# Altium schematic sheet vi_dieu_khien.SchDoc
size C; SheetNumber: 2; SheetTotal: 5
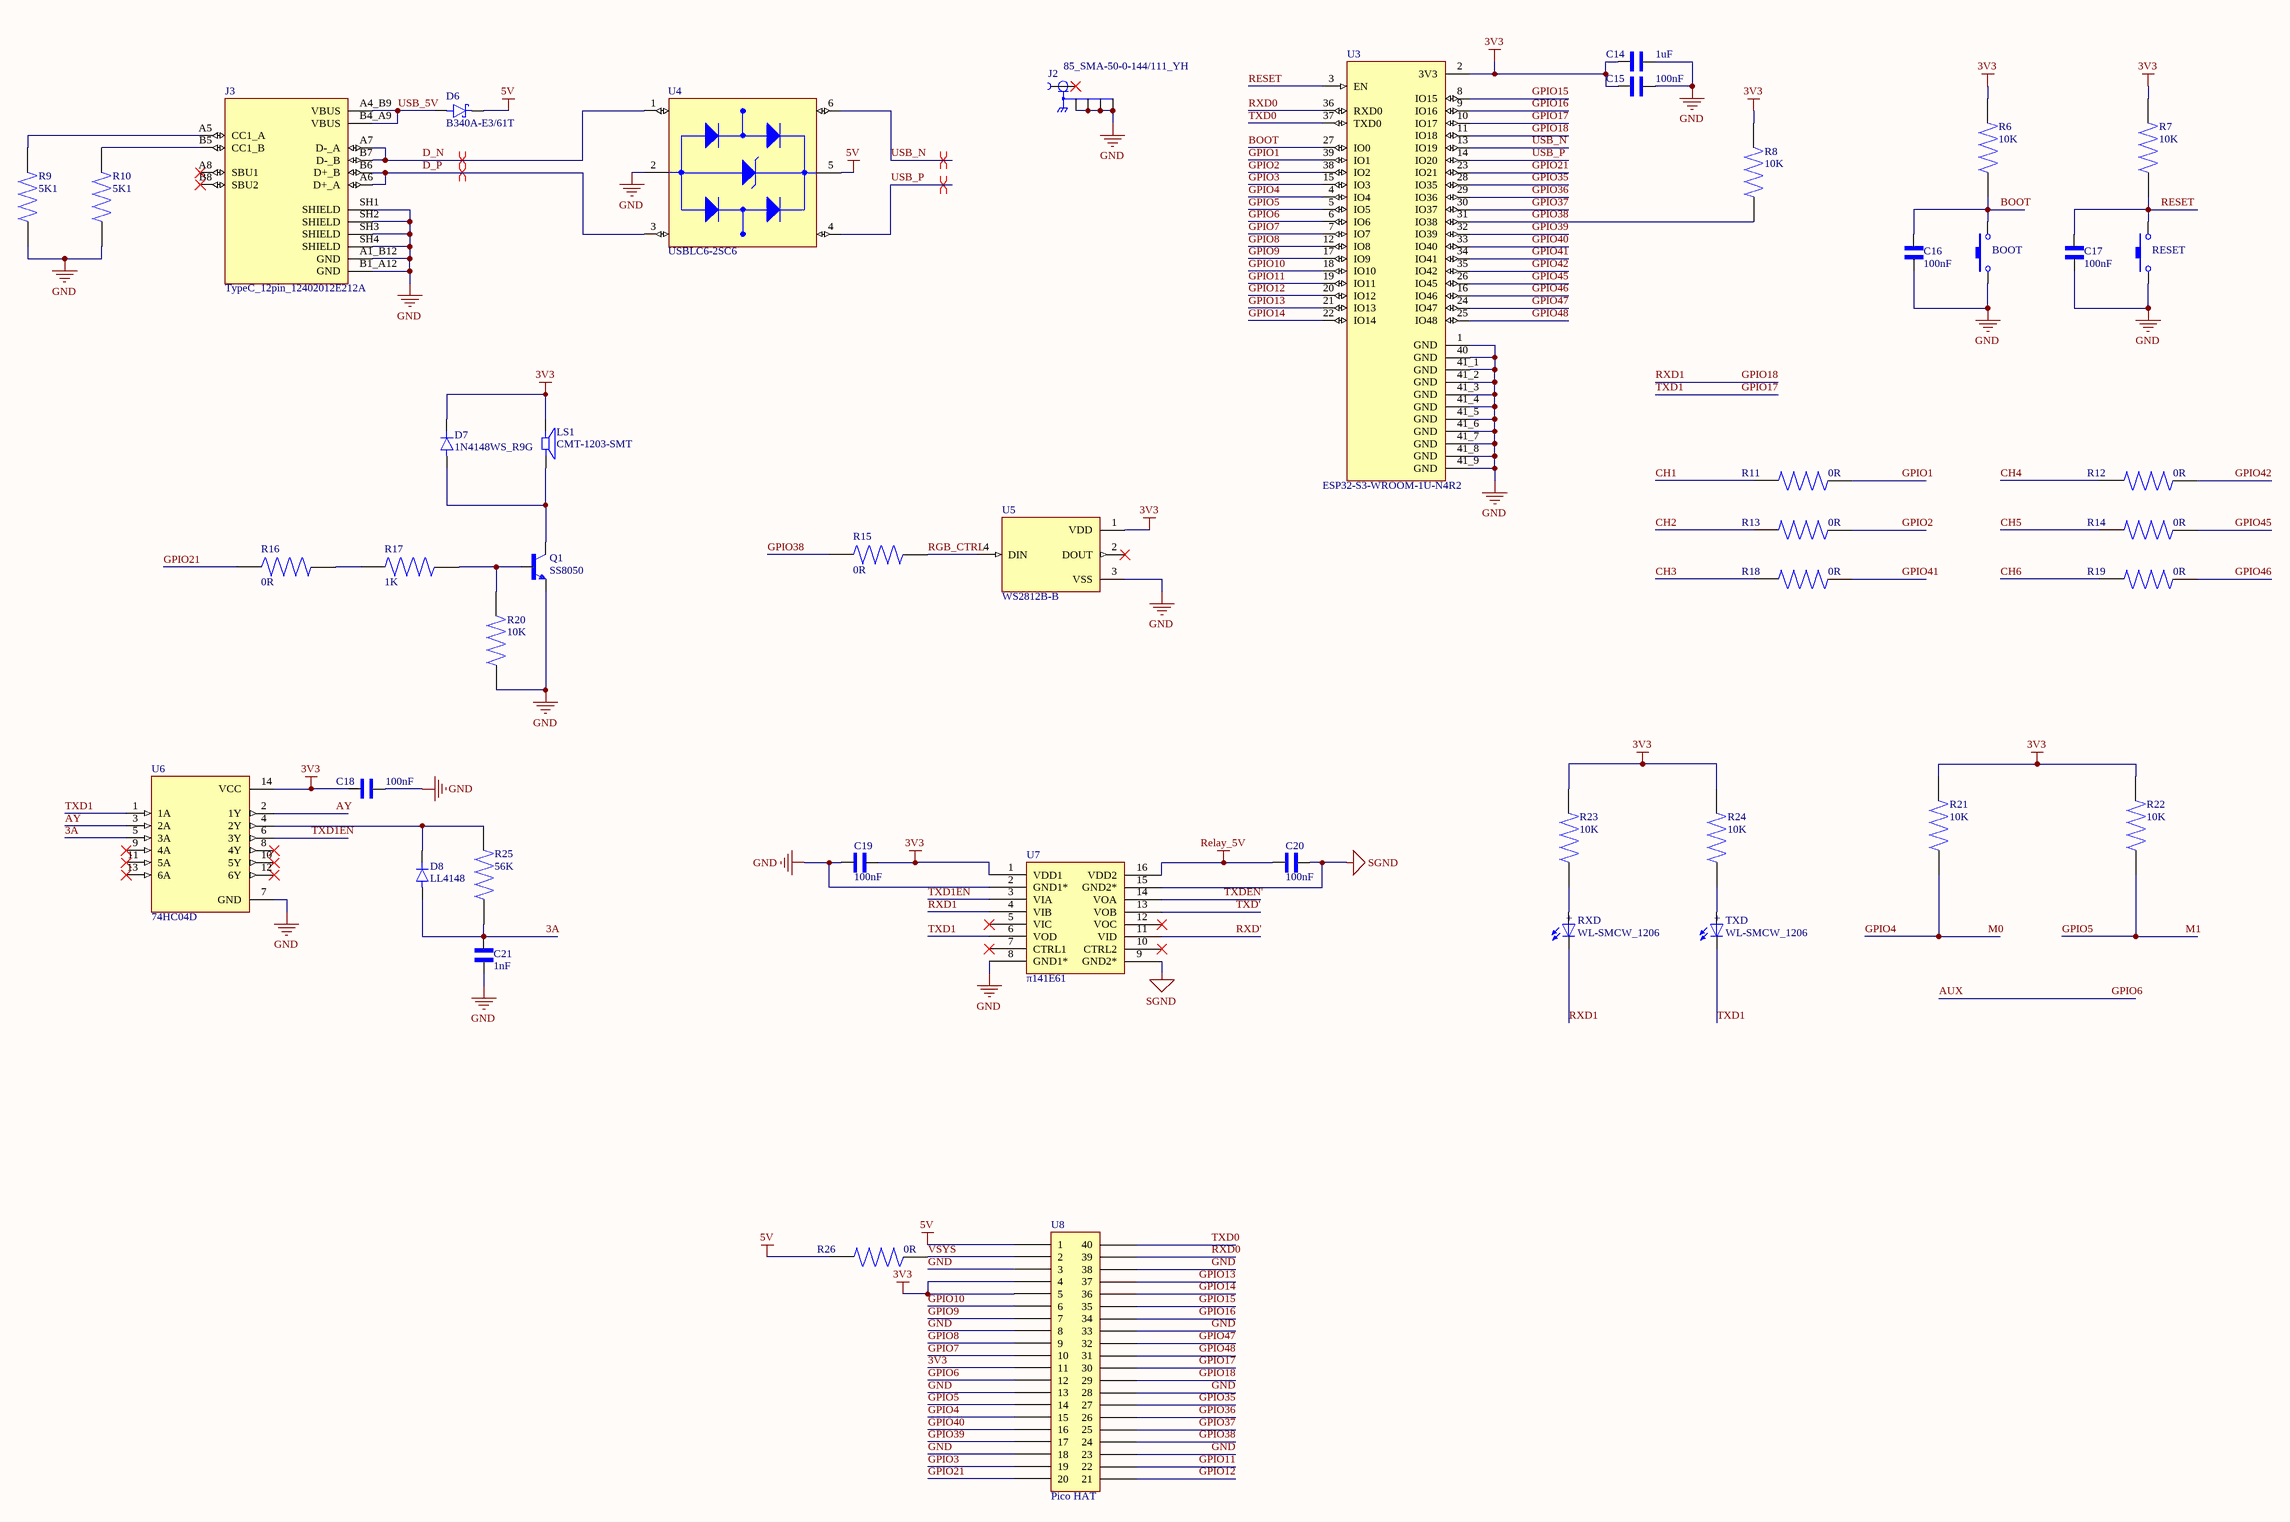
[diagram p0: vi_dieu_khien.SchDoc]

## Parts
BOOT  Nut Nhan 2 Chan SMD 3x6x2.5  [PCBComponent_1]  (value not drawn)
C14  1uF  [CAPC1608X94N]
C15  100nF  [CAPC1608X94N]
C16  100nF  [CAPC1608X94N]
C17  100nF  [CAPC1608X94N]
C18  100nF  [CAPC1608X94N]
C19  100nF  [CAPC1608X94N]
C20  100nF  [CAPC1608X94N]
C21  1nF  [CAPC1608X94N]
D6  B340A-E3/61T  [DIOM5126X229N]
D7  1N4148WS_R9G  [DIO_1N4148WS_R9G]
D8  LL4148  [DIO_LL4148]
J2  85_SMA-50-0-144/111_YH  [HUBER+SUHNER_85_SMA-50-0-144/111_YH]
J3  TypeC_12pin_12402012E212A  [TypeC_12pin_12402012E212A]
LS1  CMT-1203-SMT  [CUI_CMT-1203-SMT]
Q1  SS8050  [SOT-23_BEC]
R6  10K  [RES_ERJU03J474V]
R7  10K  [RES_ERJU03J474V]
R8  10K  [RES_ERJU03J474V]
R9  5K1  [RES_ERJU03J474V]
R10  5K1  [RES_ERJU03J474V]
R11  0R  [RES_ERJU03J474V]
R12  0R  [RES_ERJU03J474V]
R13  0R  [RES_ERJU03J474V]
R14  0R  [RES_ERJU03J474V]
R15  0R  [RES_ERJU03J474V]
R16  0R  [RES_ERJU03J474V]
R17  1K  [RES_ERJU03J474V]
R18  0R  [RES_ERJU03J474V]
R19  0R  [RES_ERJU03J474V]
R20  10K  [RES_ERJU03J474V]
R21  10K  [RES_ERJU03J474V]
R22  10K  [RES_ERJU03J474V]
R23  10K  [RES_ERJU03J474V]
R24  10K  [RES_ERJU03J474V]
R25  56K  [RES_ERJU03J474V]
R26  0R  [RES_ERJU03J474V]
RESET  Nut Nhan 2 Chan SMD 3x6x2.5  [PCBComponent_1]  (value not drawn)
RXD  WL-SMCW_1206  [WL-SMCW_1206]
TXD  WL-SMCW_1206  [WL-SMCW_1206]
U3  ESP32-S3-WROOM-1U-N4R2  [XCVR_ESP32-S3-WROOM-1U-N4R2]
U4  USBLC6-2SC6  [USBLC6-2SC6]
U5  WS2812B-B  [LED_WS2812B-B]
U6  74HC04D  [SOP127P600X170-14N]
U7  π141E61  [SOIC127P1032X265-16N]
U8  Pico HAT  [Pico_HAT]

## Nets
3V3: C14.1 C15.1 C18.1 C19.1 D7.C(K) LS1.1 R6.2 R7.2 R8.2 R21.2 R22.2 R23.2 R24.2 U3.2(3V3) U5.1(VDD) U6.14(VCC) U7.1(VDD1) U8.4 U8.5 U8.11
5V: D6.C R26.2 U4.5(VBUS) U8.1
GND: BOOT.1 C14.2 C15.2 C16.1 C17.1 C18.2 C19.2 C21.1 J2.G1 J2.G2 J2.G3 J2.G4 J3.A1_B12(GND) J3.B1_A12(GND) J3.SH1(SHIELD) J3.SH2(SHIELD) J3.SH3(SHIELD) J3.SH4(SHIELD) Q1.E R9.1 R10.1 R20.1 RESET.1 U3.1(GND) U3.40(GND) U3.41_1(GND) U3.41_2(GND) U3.41_3(GND) U3.41_4(GND) U3.41_5(GND) U3.41_6(GND) U3.41_7(GND) U3.41_8(GND) U3.41_9(GND) U4.2(GND) U5.3(VSS) U6.7(GND) U7.2(GND1*) U7.8(GND1*) U8.3 U8.8 U8.13 U8.18 U8.23 U8.28 U8.33 U8.38
Relay_5V: C20.2 U7.16(VDD2)
SGND: C20.1 U7.9(GND2*) U7.15(GND2*)
3A: C21.2 D8.A R25.1 U6.5(3A)
AUX: U3.6(IO6) U8.12  [also labelled GPIO6]
AY: U6.2(1Y) U6.3(2A)
BOOT: BOOT.2 C16.2 R6.1 U3.27(IO0)
CH1: R11.2
CH2: R13.2
CH3: R18.2
CH4: R12.2
CH5: R14.2
CH6: R19.2
D_N: J3.A7(D-_A) J3.B7(D-_B) U4.1(I/O1_IN)
D_P: J3.A6(D+_A) J3.B6(D+_B) U4.3(I/O2_IN)
GPIO1: R11.1 U3.39(IO1)
GPIO2: R13.1 U3.38(IO2)
GPIO3: U3.15(IO3) U8.19
GPIO4: R21.1 U3.4(IO4) U8.15  [also labelled M0]
GPIO5: R22.1 U3.5(IO5) U8.14  [also labelled M1]
GPIO7: U3.7(IO7) U8.10
GPIO8: U3.12(IO8) U8.9
GPIO9: U3.17(IO9) U8.7
GPIO10: U3.18(IO10) U8.6
GPIO11: U3.19(IO11) U8.22
GPIO12: U3.20(IO12) U8.21
GPIO13: U3.21(IO13) U8.37
GPIO14: U3.22(IO14) U8.36
GPIO15: U3.8(IO15) U8.35
GPIO16: U3.9(IO16) U8.34
GPIO17: TXD.1(NEG) U3.10(IO17) U6.1(1A) U7.6(VOD) U8.30  [also labelled TXD1]
GPIO18: RXD.1(NEG) U3.11(IO18) U7.4(VIB) U8.29  [also labelled RXD1]
GPIO21: R16.1 U3.23(IO21) U8.20
GPIO35: U3.28(IO35) U8.27
GPIO36: U3.29(IO36) U8.26
GPIO37: U3.30(IO37) U8.25
GPIO38: R8.1 R15.1 U3.31(IO38) U8.24
GPIO39: U3.32(IO39) U8.17
GPIO40: U3.33(IO40) U8.16
GPIO41: R18.1 U3.34(IO41)
GPIO42: R12.1 U3.35(IO42)
GPIO45: R14.1 U3.26(IO45)
GPIO46: R19.1 U3.16(IO46)
GPIO47: U3.24(IO47) U8.32
GPIO48: U3.25(IO48) U8.31
RESET: C17.2 R7.1 RESET.2 U3.3(EN)
RGB_CTRL: R15.2 U5.4(DIN)
RXD0: U3.36(RXD0) U8.39
RXD': U7.11(VID)
TXD0: U3.37(TXD0) U8.40
TXD1EN: U6.6(3Y) U7.3(VIA)
TXD': U7.13(VOB)
TXDEN': U7.14(VOA)
USB_5V: D6.A J3.A4_B9(VBUS) J3.B4_A9(VBUS)
USB_N: U3.13(IO19) U4.6(I/O1_OUT)
USB_P: U3.14(IO20) U4.4(I/O2_OUT)
VSYS: R26.1 U8.2
NetD7_A: D7.A LS1.2 Q1.C
NetD8_C: D8.C R25.2 U6.4(2Y)
NetJ3_A5: J3.A5(CC1_A) R9.2
NetJ3_B5: J3.B5(CC1_B) R10.2
NetQ1_B: Q1.B R17.2 R20.2
NetR16_2: R16.2 R17.1
NetR23_1: R23.1 RXD.2(POS)
NetR24_1: R24.1 TXD.2(POS)

Not connected (* = marked no-connect by the designer): J2 1*; J3 A8(SBU1)* B8(SBU2)*; U5 2(DOUT)*; U6 8(4Y)* 9(4A)* 10(5Y)* 11(5A)* 12(6Y)* 13(6A)*; U7 5(VIC)* 7(CTRL1)* 10(CTRL2)* 12(VOC)*

## Layout directives
differential pair: D_N, D_P, USB_N, USB_P

## Notes on the sheet
- (in symbol WL-SMCW_1206) +

## Library data of the parts
BOOT RESET = Nut Nhan 2 Chan SMD 3x6x2.5: Ma_Hang: MH001036; Ten: Nút Nhấn 2 Chân 3x6x2.5MM SMD
C14-C21 = cap_0603_VJ0603D3R9DXCAP: cap 0603 (1608 Metric); MF: Vishay Vitramon; SnapEDA_Link: https://www.snapeda.com/parts/VJ0603D3R9DXCAP/Vishay/view-part/?ref=snap; Package: 1608 Vishay Vitramon; Value: *; MP: VJ0603D3R9DXCAP; Check_prices: https://www.snapeda.com/parts/VJ0603D3R9DXCAP/Vishay/view-part/?ref=eda
D6 = B340A-E3/61T: Diode Schottky 40 V 3A Surface Mount DO-214AC (SMA); MF: Vishay Semiconductor; SnapEDA_Link: https://www.snapeda.com/parts/B340A-E3/61T/Vishay/view-part/?ref=snap; Package: DO-214 Vishay Semiconductor; Value: *; MP: B340A-E3/61T; Check_prices: https://www.snapeda.com/parts/B340A-E3/61T/Vishay/view-part/?ref=eda
D7 = 1N4148WS_R9G: 150mA, 100V High Speed SMD Switching Diode; MF: Taiwan Semiconductor; MP: 1N4148WS R9G; SnapEDA_Link: https://www.snapeda.com/parts/1N4148WS%20R9G/Taiwan+Semiconductor/view-part/?ref=snap; Package: SOD-323F Taiwan Semiconductor; Value: *; Check_prices: https://www.snapeda.com/parts/1N4148WS%20R9G/Taiwan+Semiconductor/view-part/?ref=eda
D8 = LL4148: Small Signal Diode, SOD-80, 100V, 0.15A, 175Â°C; MF: Diotec Semiconductor; SnapEDA_Link: https://www.snapeda.com/parts/LL4148/Diotec/view-part/?ref=snap; Package: SOD-80 Diotec; Value: *; MP: LL4148; Check_prices: https://www.snapeda.com/parts/LL4148/Diotec/view-part/?ref=eda
J2 = 85_SMA-50-0-144/111_YH: RF Connector, SMA Right angle PCB jack(f) | HUBER+SUHNER 85_SMA-50-0-144/111_YH; SnapEDA_Link: https://www.snapeda.com/parts/85_SMA-50-0-144/111_YH/Huber%252BSuhner/view-part/?ref=snap; Package: None; Value: *; MF: HUBER+SUHNER; MP: 85_SMA-50-0-144/111_YH; Check_prices: https://www.snapeda.com/parts/85_SMA-50-0-144/111_YH/Huber%252BSuhner/view-part/?ref=eda
J3 = TypeC_12pin_12402012E212A: USB2.0, Type C, Top mount, CH 1.68mm, Dual Row SMT; MF: Amphenol ICC (Commercial Products); MP: 12402012E212A; Price: None; Package: None; Availability: In Stock; SnapEDA_Link: https://www.snapeda.com/parts/12402012E212A/Amphenol/view-part/?ref=snap; Value: *; Check_prices: https://www.snapeda.com/parts/12402012E212A/Amphenol/view-part/?ref=eda; Purchase-URL: https://pricing.snapeda.com/search/part/12402012E212A/?ref=eda
LS1 = CMT-1203-SMT: 12 mm, 25 V, 81 dB, Surface Mount (SMT), Piezo Audio Transducer Buzzer; MF: Same Sky; MP: CMT-1203-SMT-TR; SnapEDA_Link: https://www.snapeda.com/parts/CMT-1203-SMT-TR/Same+Sky/view-part/?ref=snap; Package: CUI Inc.; Value: *; Check_prices: https://www.snapeda.com/parts/CMT-1203-SMT-TR/Same+Sky/view-part/?ref=eda
Q1 = SS8050: NPN Epitaxial Silicon Transistor; MF: ON Semiconductor / Fairchild; SnapEDA_Link: https://www.snapeda.com/parts/SS8050/Fairchild+Semiconductor/view-part/?ref=snap; Package: TO-92-3 ON Semiconductor; Value: *; MP: SS8050; Check_prices: https://www.snapeda.com/parts/SS8050/Fairchild+Semiconductor/view-part/?ref=eda
R6-R26 = res_0603_ERJU03J474V: 0603 Anti-Sulfurated; MF: Panasonic; SnapEDA_Link: https://www.snapeda.com/parts/ERJU03J474V/Panasonic/view-part/?ref=snap; Package: 1608-2 Panasonic; Value: *; MP: ERJU03J474V; Check_prices: https://www.snapeda.com/parts/ERJU03J474V/Panasonic/view-part/?ref=eda
RXD TXD = WL-SMCW_1206: 1206, Blue Typ.(@20mA): 470nm, 145mcd, 3.2V, 140Â° InGaN; MF: Wurth Electronics; MP: 150120BS75000; SnapEDA_Link: https://www.snapeda.com/parts/150120BS75000/Wurth+Electronics/view-part/?ref=snap; Package: 1206 Wurth Electronics; Value: *; Check_prices: https://www.snapeda.com/parts/150120BS75000/Wurth+Electronics/view-part/?ref=eda
U3 = ESP32-S3-WROOM-1U-N4R2: MF: {'manufacturer': u'Espressif Systems'}; Package: None; Price: None; Value: *; MP: ESP32-S3-WROOM-1U-N4R2; Availability: Unavailable
U4 = USBLC6-2SC6: 17V Clamp 5A (8/20Âµs) Ipp Tvs Diode Surface Mount SOT-23-6; MF: STMicroelectronics; Value: *; SnapEDA_Link: https://www.snapeda.com/parts/USBLC6-2SC6/STMicroelectronics/view-part/?ref=snap; Check_prices: https://www.snapeda.com/parts/USBLC6-2SC6/STMicroelectronics/view-part/?ref=eda; Purchase-URL: https://pricing.snapeda.com/search/part/USBLC6-2SC6/?ref=eda; Price: None; Availability: In Stock; Package: SOT-23-6 STMicroelectronics; MP: USBLC6-2SC6
U5 = WS2812B-B: Intelligent control LED integrated light source; Availability: Unavailable; Price: None; Package: None; MP: WS2812B-B; Value: *
U6 = 74HC04D: Hex Inverters; MF: TAEJIN; SnapEDA_Link: https://www.snapeda.com/parts/74HC04D/TAEJIN/view-part/?ref=snap; Package: SOP-14 TAEJIN; Value: *; MP: 74HC04D; Check_prices: https://www.snapeda.com/parts/74HC04D/TAEJIN/view-part/?ref=eda
U7 = 141E61: 4-Channel Digital Isolator, 3 Forward/1 Reverse, 5kVrms Isolation, SOIC-16 Wide , (300mil), SMD,π141E61